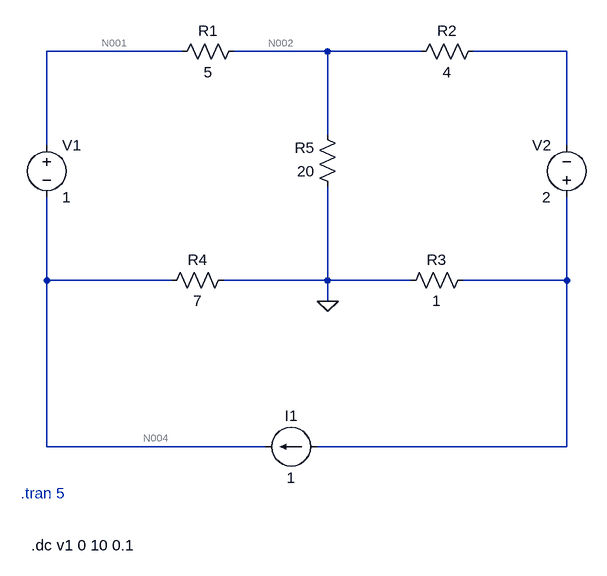
[diagram p0: schematic lab1_1.asc]
lab1_1.asc, the LTspice schematic file:
Version 4.1
SHEET 1 1184 744
WIRE 336 -32 128 -32
WIRE 560 -32 416 -32
WIRE 704 -32 560 -32
WIRE 928 -32 784 -32
WIRE 560 96 560 -32
WIRE 128 112 128 -32
WIRE 928 112 928 -32
WIRE 128 320 128 192
WIRE 320 320 128 320
WIRE 560 320 560 176
WIRE 560 320 400 320
WIRE 688 320 560 320
WIRE 928 320 928 192
WIRE 928 320 768 320
WIRE 560 352 560 320
WIRE 128 576 128 320
WIRE 464 576 128 576
WIRE 928 576 928 320
WIRE 928 576 544 576
FLAG 560 352 0
SYMBOL voltage 128 96 R0
WINDOW 123 0 0 Left 0
WINDOW 39 0 0 Left 0
SYMATTR InstName V1
SYMATTR Value 1
SYMBOL voltage 928 208 R180
WINDOW 0 24 96 Left 2
WINDOW 3 24 16 Left 2
WINDOW 123 0 0 Left 0
WINDOW 39 0 0 Left 0
SYMATTR InstName V2
SYMATTR Value 2
SYMBOL current 544 576 R90
WINDOW 0 -32 40 VBottom 2
WINDOW 3 32 40 VTop 2
WINDOW 123 0 0 Left 0
WINDOW 39 0 0 Left 0
SYMATTR InstName I1
SYMATTR Value 1
SYMBOL res 432 -48 R90
WINDOW 0 0 56 VBottom 2
WINDOW 3 32 56 VTop 2
SYMATTR InstName R1
SYMATTR Value 5
SYMBOL res 416 304 R90
WINDOW 0 0 56 VBottom 2
WINDOW 3 32 56 VTop 2
SYMATTR InstName R4
SYMATTR Value 7
SYMBOL res 576 192 R180
WINDOW 0 36 76 Left 2
WINDOW 3 36 40 Left 2
SYMATTR InstName R5
SYMATTR Value 20
SYMBOL res 784 304 R90
WINDOW 0 0 56 VBottom 2
WINDOW 3 32 56 VTop 2
SYMATTR InstName R3
SYMATTR Value 1
SYMBOL res 800 -48 R90
WINDOW 0 0 56 VBottom 2
WINDOW 3 32 56 VTop 2
SYMATTR InstName R2
SYMATTR Value 4
TEXT 88 648 Left 2 ;.tran 5
TEXT 104 728 Left 2 !.dc v1 0 10 0.1

The netlist it stands for:
* lab1_1.asc
V1 N001 N004 1
V2 N005 N003 2
I1 N005 N004 1
R1 N002 N001 5
R4 0 N004 7
R5 0 N002 20
R3 N005 0 1
R2 N003 N002 4
* .tran 5
.dc v1 0 10 0.1
.backanno
.end

* Results of the author's LTspice run, read from the files saved beside the schematic
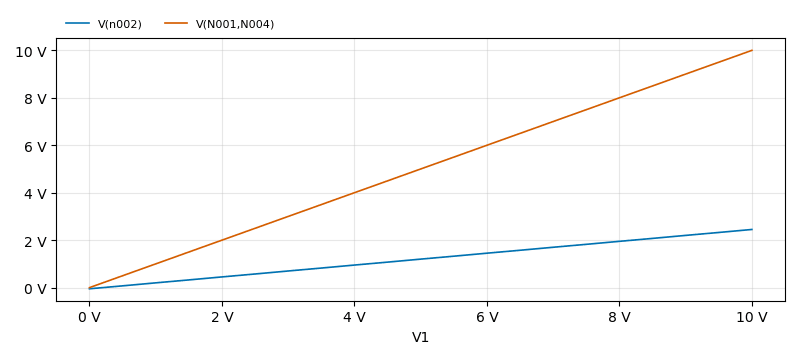
[diagram p1: DC transfer characteristic of lab1_1.asc, plotted from the saved traces]
* DC transfer characteristic, 1 run:
*   V(n002): -50 mV at V1=0 V, 2.45 V at V1=10 V, min -50 mV, max 2.45 V
*   V(N001,N004): 0 V at V1=0 V, 10 V at V1=10 V, min 0 V, max 10 V